# Altium schematic sheet 04_TFT_Display_NeoPixel.SchDoc: 04_TFT_Display_NeoPixel.SchDoc
size Letter; Author: Miguel Donis; Organization: Altium Limited; Address1: L3, 12a Rodborough Rd; Address2: Frenchs Forest; Address3: NSW; Address4: Australia 2086; Revision: 1.0; SheetNumber: 4; SheetTotal: 5; Carnet: 22993; Curso: Digital 2; ProjectName: proyecto 3
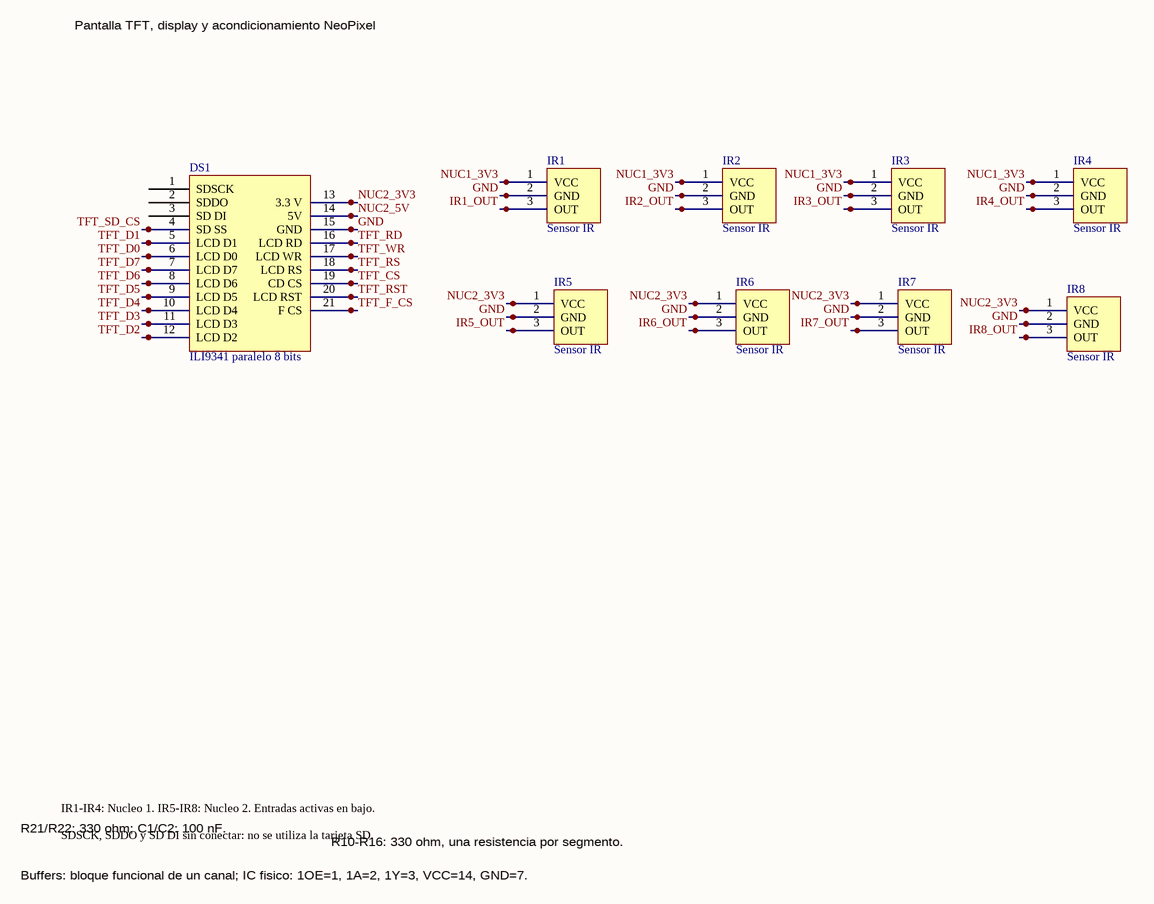
[diagram p0: 04_TFT_Display_NeoPixel.SchDoc]

## Parts
DS1  ILI9341 paralelo 8 bits
IR1  Sensor IR
IR2  Sensor IR
IR3  Sensor IR
IR4  Sensor IR
IR5  Sensor IR
IR6  Sensor IR
IR7  Sensor IR
IR8  Sensor IR

## Nets
GND: DS1.15(GND) IR1.2(GND) IR2.2(GND) IR3.2(GND) IR4.2(GND) IR5.2(GND) IR6.2(GND) IR7.2(GND) IR8.2(GND)
IR1_OUT: IR1.3(OUT)
IR2_OUT: IR2.3(OUT)
IR3_OUT: IR3.3(OUT)
IR4_OUT: IR4.3(OUT)
IR5_OUT: IR5.3(OUT)
IR6_OUT: IR6.3(OUT)
IR7_OUT: IR7.3(OUT)
IR8_OUT: IR8.3(OUT)
NUC1_3V3: IR1.1(VCC) IR2.1(VCC) IR3.1(VCC) IR4.1(VCC)
NUC2_3V3: DS1.13(3.3_V) IR5.1(VCC) IR6.1(VCC) IR7.1(VCC) IR8.1(VCC)
NUC2_5V: DS1.14(5V)
TFT_CS: DS1.19(CD_CS)
TFT_D0: DS1.6(LCD_D0)
TFT_D1: DS1.5(LCD_D1)
TFT_D2: DS1.12(LCD_D2)
TFT_D3: DS1.11(LCD_D3)
TFT_D4: DS1.10(LCD_D4)
TFT_D5: DS1.9(LCD_D5)
TFT_D6: DS1.8(LCD_D6)
TFT_D7: DS1.7(LCD_D7)
TFT_F_CS: DS1.21(F_CS)
TFT_RD: DS1.16(LCD_RD)
TFT_RS: DS1.18(LCD_RS)
TFT_RST: DS1.20(LCD_RST)
TFT_SD_CS: DS1.4(SD_SS)
TFT_WR: DS1.17(LCD_WR)

Not connected (* = marked no-connect by the designer): DS1 1(SDSCK) 2(SDDO) 3(SD_DI)

## Notes on the sheet
- Pantalla TFT, display y acondicionamiento NeoPixel
- R21/R22: 330 ohm; C1/C2: 100 nF.
- IR1-IR4: Nucleo 1. IR5-IR8: Nucleo 2. Entradas activas en bajo.
- SDSCK, SDDO y SD DI sin conectar: no se utiliza la tarjeta SD.
- R10-R16: 330 ohm, una resistencia por segmento.
- Buffers: bloque funcional de un canal; IC fisico: 1OE=1, 1A=2, 1Y=3, VCC=14, GND=7.
- Proyecto:
- Autor:
- Documento:
- Carnet:
- Curso:
- Revision:
- Fecha:
- Tamaño:
- Carta
- Hoja:
- De:

## Library data of the parts
DS1 = ili